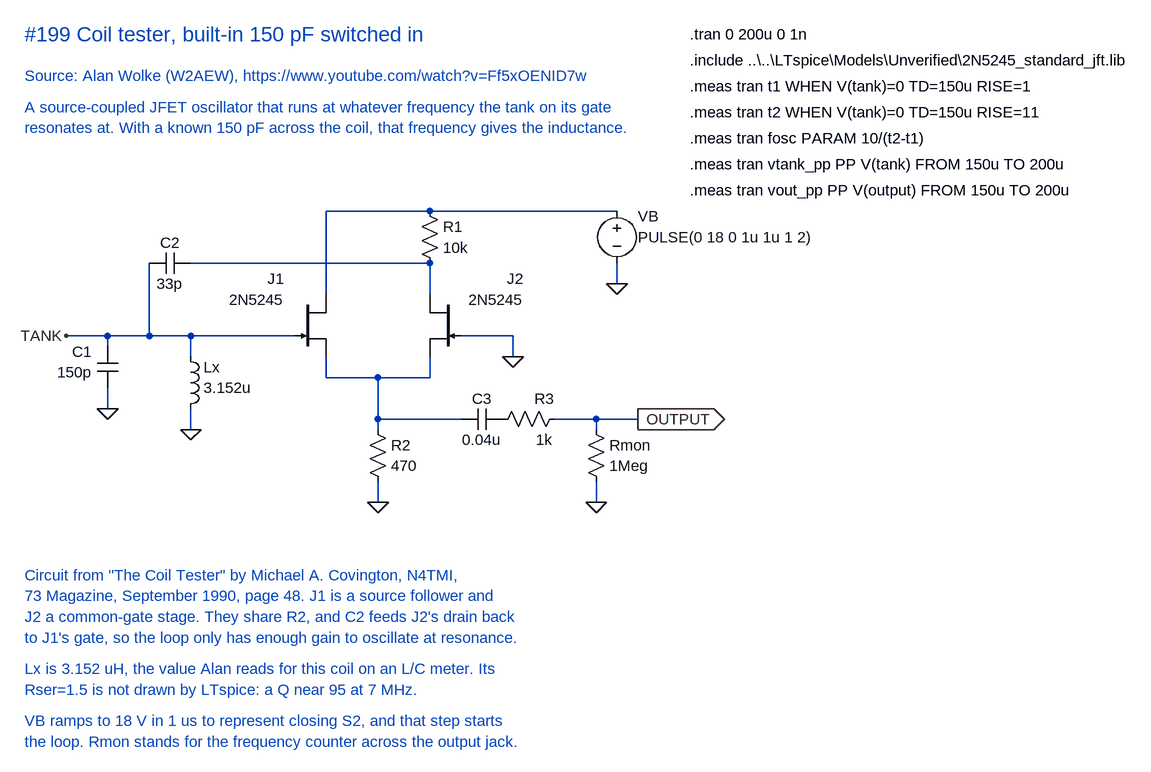
[diagram p0: schematic Coil tester with the built-in capacitor.asc]
Coil tester with the built-in capacitor.asc, the LTspice schematic file:
Version 4
SHEET 1 1400 900
WIRE 304 288 592 288
WIRE 304 288 304 304
WIRE 304 368 304 400
WIRE 368 288 368 176
WIRE 432 176 800 176
WIRE 432 288 432 320
WIRE 432 400 432 432
WIRE 240 288 304 288
WIRE 640 224 640 96
WIRE 640 96 1088 96
WIRE 800 176 800 224
WIRE 640 320 640 352
WIRE 800 320 800 352
WIRE 640 352 800 352
WIRE 720 352 720 416
WIRE 720 416 720 432
WIRE 720 512 720 544
WIRE 848 288 928 288
WIRE 928 288 928 320
WIRE 720 416 848 416
WIRE 992 416 1120 416
WIRE 1056 416 1056 432
WIRE 1056 512 1056 544
WIRE 1088 176 1088 208
FLAG 304 400 0
FLAG 432 432 0
FLAG 720 544 0
FLAG 928 320 0
FLAG 1056 544 0
FLAG 1088 208 0
FLAG 240 288 TANK
FLAG 1120 416 OUTPUT
IOPIN 1120 416 Out
SYMBOL njf 592 224 R0
WINDOW 0 -16 -24 Right 2
WINDOW 3 -16 8 Right 2
SYMATTR InstName J1
SYMATTR Value 2N5245
SYMBOL njf 848 224 M0
WINDOW 0 -96 -24 Left 2
WINDOW 3 -96 8 Left 2
SYMATTR InstName J2
SYMATTR Value 2N5245
SYMBOL res 784 80 R0
WINDOW 0 36 40 Left 2
WINDOW 3 36 72 Left 2
SYMATTR InstName R1
SYMATTR Value 10k
SYMBOL res 704 416 R0
WINDOW 0 36 40 Left 2
WINDOW 3 36 72 Left 2
SYMATTR InstName R2
SYMATTR Value 470
SYMBOL cap 432 160 R90
WINDOW 0 0 32 VBottom 2
WINDOW 3 32 32 VTop 2
SYMATTR InstName C2
SYMATTR Value 33p
SYMBOL cap 288 304 R0
WINDOW 0 -8 8 Right 2
WINDOW 3 -8 40 Right 2
SYMATTR InstName C1
SYMATTR Value 150p
SYMBOL ind 416 304 R0
WINDOW 0 36 32 Left 2
WINDOW 3 36 64 Left 2
SYMATTR InstName Lx
SYMATTR Value 3.152u
SYMATTR SpiceLine Rser=1.5
SYMBOL cap 912 400 R90
WINDOW 0 0 32 VBottom 2
WINDOW 3 32 32 VTop 2
SYMATTR InstName C3
SYMATTR Value 0.04u
SYMBOL res 1008 400 R90
WINDOW 0 0 32 VBottom 2
WINDOW 3 32 32 VTop 2
SYMATTR InstName R3
SYMATTR Value 1k
SYMBOL res 1040 416 R0
WINDOW 0 36 40 Left 2
WINDOW 3 36 72 Left 2
SYMATTR InstName Rmon
SYMATTR Value 1Meg
SYMBOL voltage 1088 80 R0
WINDOW 0 32 24 Left 2
WINDOW 3 32 56 Left 2
SYMATTR InstName VB
SYMATTR Value PULSE(0 18 0 1u 1u 1 2)
TEXT 176 -176 Left 3 ;#199 Coil tester, built-in 150 pF switched in
TEXT 176 -112 Left 2 ;Source: Alan Wolke (W2AEW), https://www.youtube.com/watch?v=Ff5xOENID7w
TEXT 176 -64 Left 2 ;A source-coupled JFET oscillator that runs at whatever frequency the tank on its gate
TEXT 176 -32 Left 2 ;resonates at. With a known 150 pF across the coil, that frequency gives the inductance.
TEXT 176 656 Left 2 ;Circuit from "The Coil Tester" by Michael A. Covington, N4TMI,
TEXT 176 688 Left 2 ;73 Magazine, September 1990, page 48. J1 is a source follower and
TEXT 176 720 Left 2 ;J2 a common-gate stage. They share R2, and C2 feeds J2's drain back
TEXT 176 752 Left 2 ;to J1's gate, so the loop only has enough gain to oscillate at resonance.
TEXT 176 800 Left 2 ;Lx is 3.152 uH, the value Alan reads for this coil on an L/C meter. Its
TEXT 176 832 Left 2 ;Rser=1.5 is not drawn by LTspice: a Q near 95 at 7 MHz.
TEXT 176 880 Left 2 ;VB ramps to 18 V in 1 us to represent closing S2, and that step starts
TEXT 176 912 Left 2 ;the loop. Rmon stands for the frequency counter across the output jack.
TEXT 1200 -176 Left 2 !.tran 0 200u 0 1n
TEXT 1200 -136 Left 2 !.include ..\..\LTspice\Models\Unverified\2N5245_standard_jft.lib
TEXT 1200 -96 Left 2 !.meas tran t1 WHEN V(tank)=0 TD=150u RISE=1
TEXT 1200 -56 Left 2 !.meas tran t2 WHEN V(tank)=0 TD=150u RISE=11
TEXT 1200 -16 Left 2 !.meas tran fosc PARAM 10/(t2-t1)
TEXT 1200 24 Left 2 !.meas tran vtank_pp PP V(tank) FROM 150u TO 200u
TEXT 1200 64 Left 2 !.meas tran vout_pp PP V(output) FROM 150u TO 200u

The netlist it stands for:
* Coil tester with the built-in capacitor.asc
J1 N002 TANK N003 2N5245
J2 N001 0 N003 2N5245
R1 N002 N001 10k
R2 N003 0 470
C2 N001 TANK 33p
C1 TANK 0 150p
Lx TANK 0 3.152u Rser=1.5
C3 P001 N003 0.04u
R3 OUTPUT P001 1k
Rmon OUTPUT 0 1Meg
VB N002 0 PULSE(0 18 0 1u 1u 1 2)
.model NJF NJF
.model PJF PJF
.lib standard.jft
* #199 Coil tester, built-in 150 pF switched in
* Source: Alan Wolke (W2AEW), https://www.youtube.com/watch?v=Ff5xOENID7w
* A source-coupled JFET oscillator that runs at whatever frequency the tank on its gate
* resonates at. With a known 150 pF across the coil, that frequency gives the inductance.
* Circuit from "The Coil Tester" by Michael A. Covington, N4TMI,
* 73 Magazine, September 1990, page 48. J1 is a source follower and
* J2 a common-gate stage. They share R2, and C2 feeds J2's drain back
* to J1's gate, so the loop only has enough gain to oscillate at resonance.
* Lx is 3.152 uH, the value Alan reads for this coil on an L/C meter. Its
* Rser=1.5 is not drawn by LTspice: a Q near 95 at 7 MHz.
* VB ramps to 18 V in 1 us to represent closing S2, and that step starts
* the loop. Rmon stands for the frequency counter across the output jack.
.tran 0 200u 0 1n
.include ..\..\LTspice\Models\Unverified\2N5245_standard_jft.lib
.meas tran t1 WHEN V(tank)=0 TD=150u RISE=1
.meas tran t2 WHEN V(tank)=0 TD=150u RISE=11
.meas tran fosc PARAM 10/(t2-t1)
.meas tran vtank_pp PP V(tank) FROM 150u TO 200u
.meas tran vout_pp PP V(output) FROM 150u TO 200u
.backanno
.end